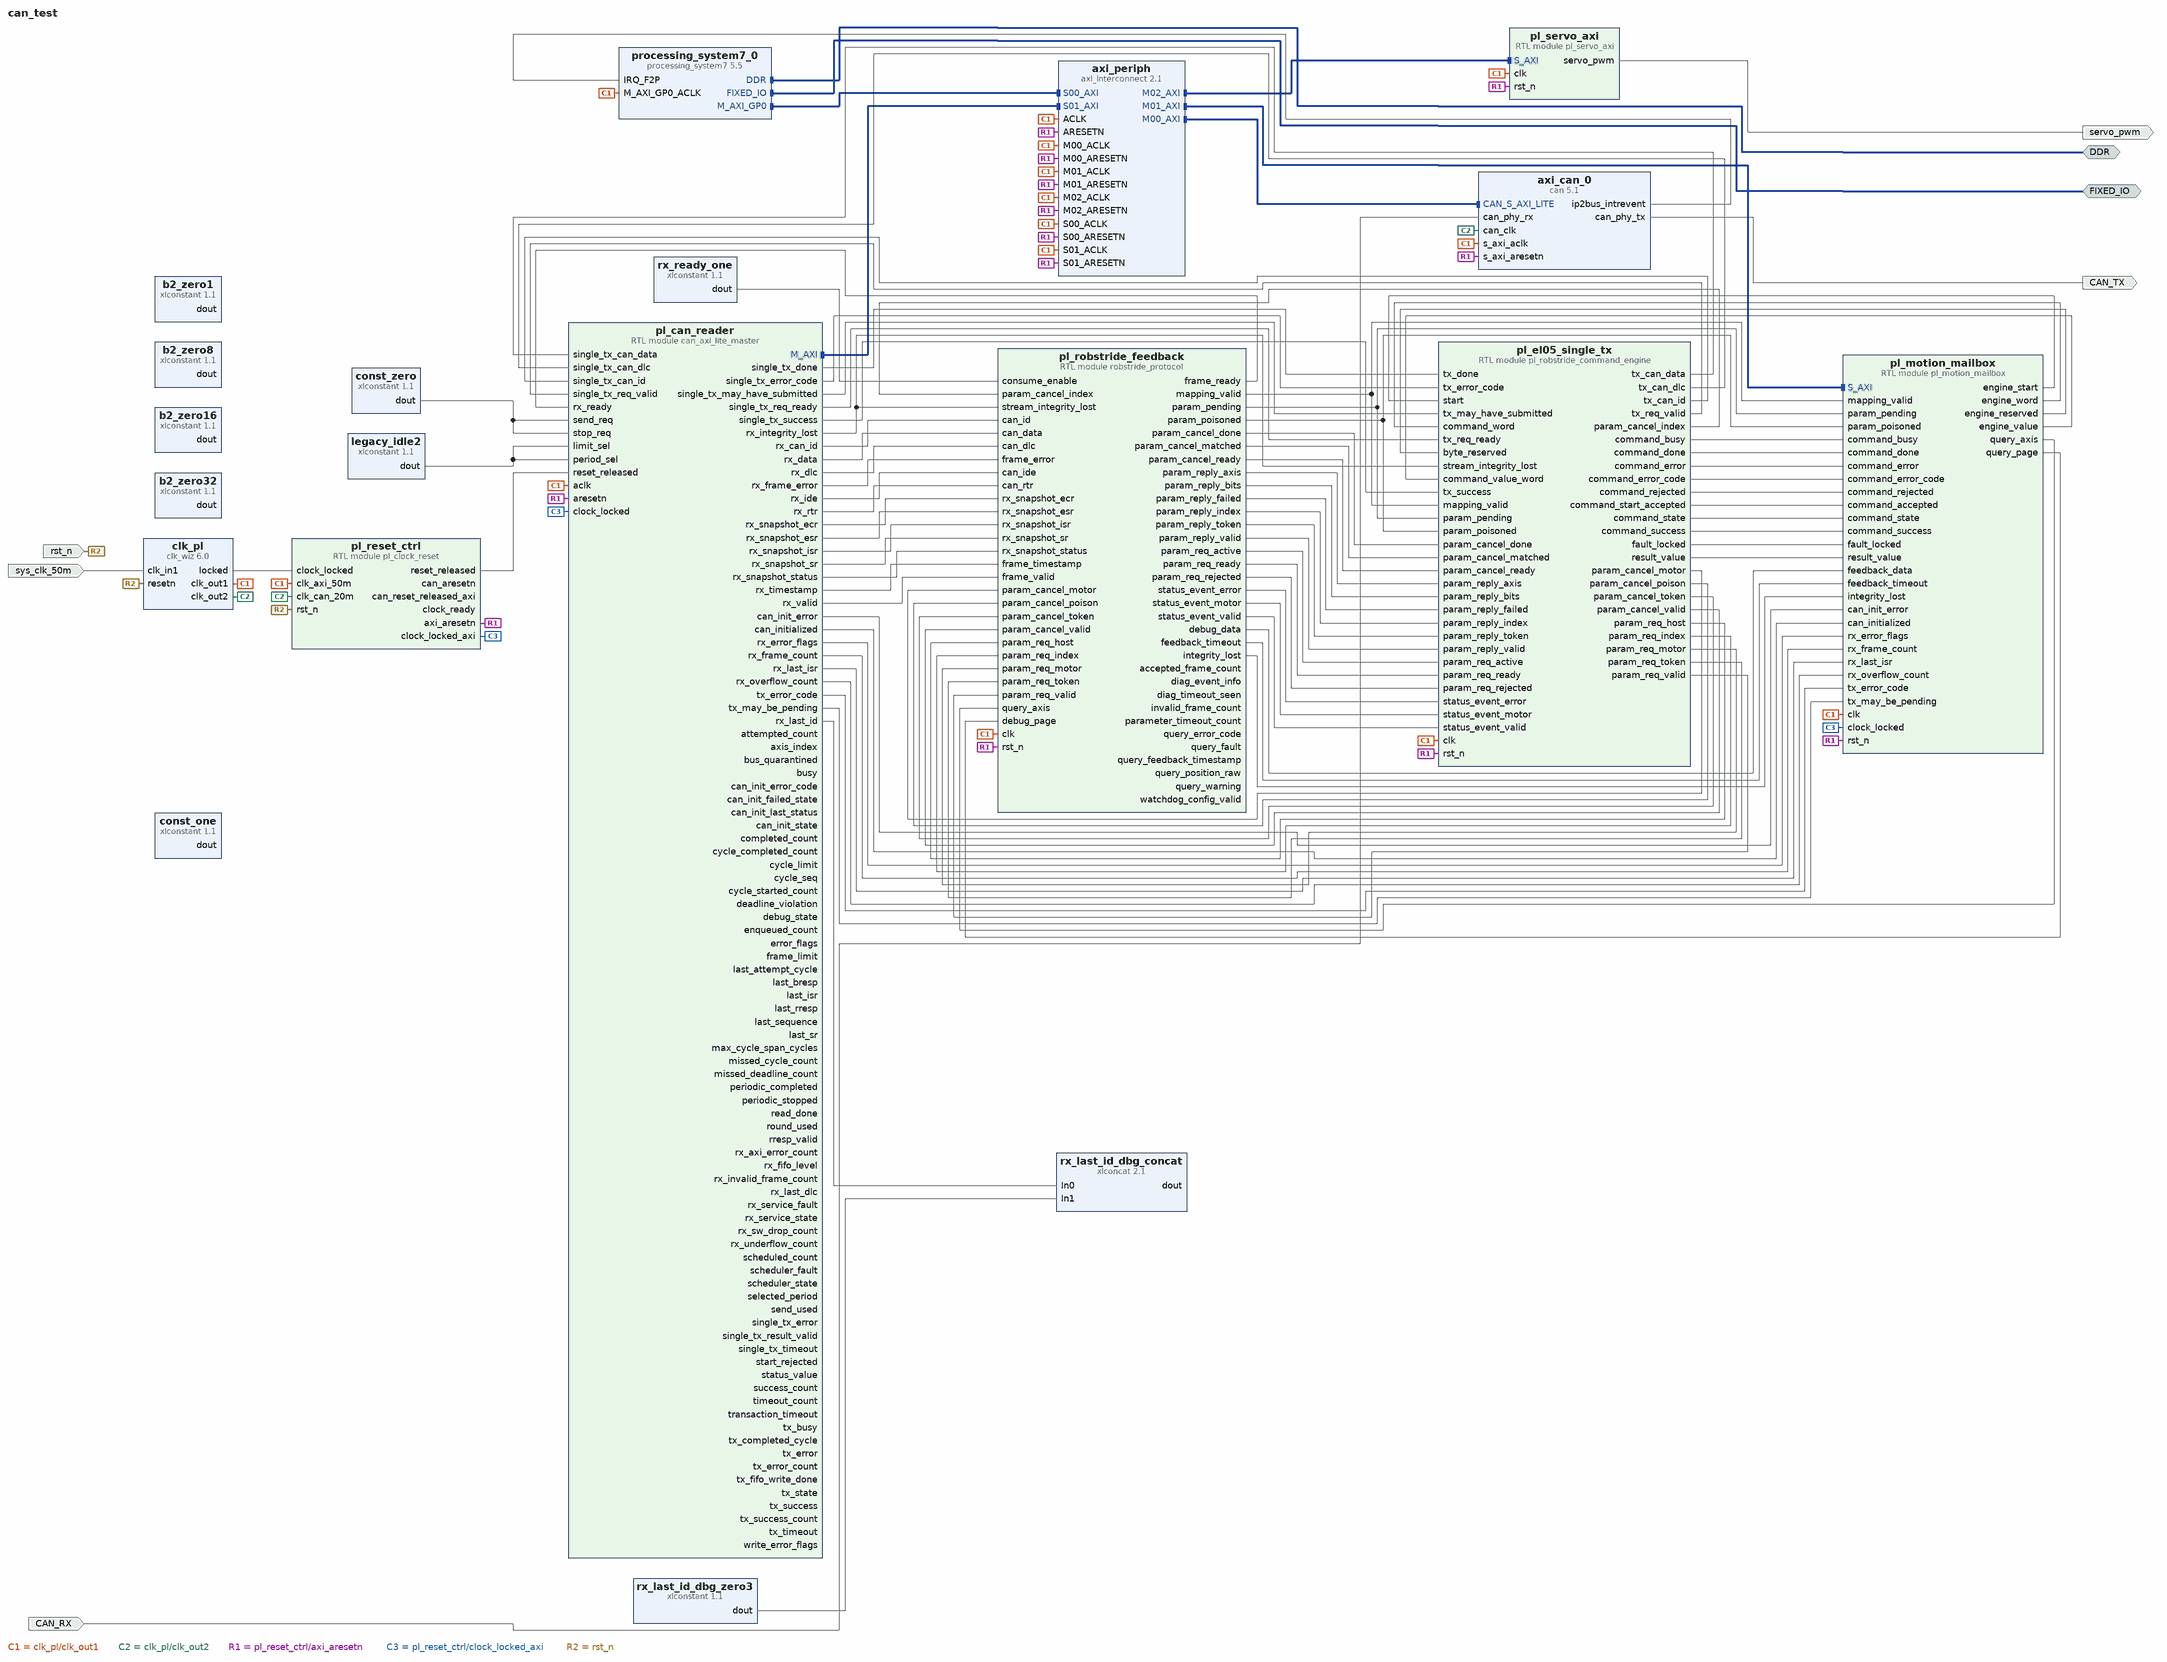
[diagram p0: block diagram of the top level]
# Vivado block design can_test, xc7z010clg400-1, Vivado 2023.1
create_bd_design can_test

create_bd_intf_port -mode Master -vlnv xilinx.com:interface:ddrx_rtl:1.0 DDR
create_bd_intf_port -mode Master -vlnv xilinx.com:display_processing_system7:fixedio_rtl:1.0 FIXED_IO
create_bd_port -dir O CAN_TX
create_bd_port -dir I CAN_RX
create_bd_port -dir I -type clk sys_clk_50m
set_property -dict {CONFIG.FREQ_HZ 50000000} [get_bd_ports sys_clk_50m]
create_bd_port -dir I -type rst rst_n
set_property -dict {CONFIG.POLARITY ACTIVE_LOW} [get_bd_ports rst_n]
create_bd_port -dir O servo_pwm

create_bd_cell -type ip -vlnv xilinx.com:ip:processing_system7:5.5 processing_system7_0
set_property -dict [list \
  CONFIG.PCW_APU_PERIPHERAL_FREQMHZ 666.666666 \
  CONFIG.PCW_ENET0_ENET0_IO {MIO 16 .. 27} \
  CONFIG.PCW_ENET0_GRP_MDIO_ENABLE 1 \
  CONFIG.PCW_ENET0_GRP_MDIO_IO {MIO 52 .. 53} \
  CONFIG.PCW_ENET0_PERIPHERAL_ENABLE 1 \
  CONFIG.PCW_ENET0_RESET_ENABLE 0 \
  CONFIG.PCW_ENET_RESET_ENABLE 1 \
  CONFIG.PCW_ENET_RESET_SELECT {Share reset pin} \
  CONFIG.PCW_EN_CLK0_PORT 0 \
  CONFIG.PCW_EN_RST0_PORT 0 \
  CONFIG.PCW_FPGA0_PERIPHERAL_FREQMHZ 50 \
  CONFIG.PCW_FPGA1_PERIPHERAL_FREQMHZ 20.000000 \
  CONFIG.PCW_GPIO_MIO_GPIO_ENABLE 1 \
  CONFIG.PCW_GPIO_MIO_GPIO_IO MIO \
  CONFIG.PCW_I2C_RESET_ENABLE 1 \
  CONFIG.PCW_IRQ_F2P_INTR 1 \
  CONFIG.PCW_PERIPHERAL_BOARD_PRESET None \
  CONFIG.PCW_PRESET_BANK1_VOLTAGE {LVCMOS 1.8V} \
  CONFIG.PCW_QSPI_GRP_SINGLE_SS_ENABLE 1 \
  CONFIG.PCW_QSPI_GRP_SINGLE_SS_IO {MIO 1 .. 6} \
  CONFIG.PCW_QSPI_PERIPHERAL_ENABLE 1 \
  CONFIG.PCW_QSPI_QSPI_IO {MIO 1 .. 6} \
  CONFIG.PCW_SD0_GRP_CD_ENABLE 1 \
  CONFIG.PCW_SD0_GRP_CD_IO {MIO 47} \
  CONFIG.PCW_SD0_GRP_WP_ENABLE 0 \
  CONFIG.PCW_SD0_PERIPHERAL_ENABLE 1 \
  CONFIG.PCW_SD0_SD0_IO {MIO 40 .. 45} \
  CONFIG.PCW_SDIO_PERIPHERAL_FREQMHZ 100 \
  CONFIG.PCW_SINGLE_QSPI_DATA_MODE x4 \
  CONFIG.PCW_UART1_PERIPHERAL_ENABLE 1 \
  CONFIG.PCW_UART1_UART1_IO {MIO 48 .. 49} \
  CONFIG.PCW_UART_PERIPHERAL_FREQMHZ 100 \
  CONFIG.PCW_UIPARAM_DDR_FREQ_MHZ 533.333333 \
  CONFIG.PCW_UIPARAM_DDR_PARTNO {MT41J128M16 HA-125} \
  CONFIG.PCW_USB0_PERIPHERAL_ENABLE 1 \
  CONFIG.PCW_USB0_RESET_ENABLE 1 \
  CONFIG.PCW_USB0_RESET_IO {MIO 46} \
  CONFIG.PCW_USB0_USB0_IO {MIO 28 .. 39} \
  CONFIG.PCW_USB_RESET_ENABLE 1 \
  CONFIG.PCW_USB_RESET_SELECT {Share reset pin} \
  CONFIG.PCW_USE_FABRIC_INTERRUPT 1 \
  CONFIG.preset None \
] [get_bd_cells processing_system7_0]
# 506 more settings of processing_system7_0 are not shown: defaults, MIO pin electricals, DDR timing, and values the tool derives
create_bd_cell -type ip -vlnv xilinx.com:ip:axi_interconnect:2.1 axi_periph
set_property -dict {CONFIG.NUM_MI 3 CONFIG.NUM_SI 2} [get_bd_cells axi_periph]
create_bd_cell -type ip -vlnv xilinx.com:ip:can:5.1 axi_can_0
set_property -dict [list \
  CONFIG.ENABLE_ECC 0 \
  CONFIG.Number_of_Acceptance_Filters 0 \
  CONFIG.Rx_Fifo_Depth 2 \
  CONFIG.Tx_Fifo_Depth 2 \
] [get_bd_cells axi_can_0]
create_bd_cell -type ip -vlnv xilinx.com:ip:xlconstant:1.1 const_zero
set_property -dict {CONFIG.CONST_VAL 0 CONFIG.CONST_WIDTH 1} [get_bd_cells const_zero]
create_bd_cell -type ip -vlnv xilinx.com:ip:xlconstant:1.1 const_one
set_property -dict {CONFIG.CONST_VAL 1 CONFIG.CONST_WIDTH 1} [get_bd_cells const_one]
create_bd_cell -type ip -vlnv xilinx.com:ip:clk_wiz:6.0 clk_pl
set_property -dict [list \
  CONFIG.CLKOUT1_DRIVES BUFG \
  CONFIG.CLKOUT1_REQUESTED_OUT_FREQ 50.000 \
  CONFIG.CLKOUT2_DRIVES BUFG \
  CONFIG.CLKOUT2_REQUESTED_OUT_FREQ 20.000 \
  CONFIG.CLKOUT2_USED true \
  CONFIG.NUM_OUT_CLKS 2 \
  CONFIG.PRIM_IN_FREQ 50.000 \
  CONFIG.RESET_TYPE ACTIVE_LOW \
  CONFIG.USE_LOCKED true \
  CONFIG.USE_RESET true \
] [get_bd_cells clk_pl]
create_bd_cell -type module -reference pl_clock_reset pl_reset_ctrl
create_bd_cell -type ip -vlnv xilinx.com:ip:xlconstant:1.1 rx_ready_one
set_property -dict {CONFIG.CONST_VAL 1 CONFIG.CONST_WIDTH 1} [get_bd_cells rx_ready_one]
create_bd_cell -type ip -vlnv xilinx.com:ip:xlconstant:1.1 b2_zero1
set_property -dict {CONFIG.CONST_VAL 0 CONFIG.CONST_WIDTH 1} [get_bd_cells b2_zero1]
create_bd_cell -type ip -vlnv xilinx.com:ip:xlconstant:1.1 b2_zero8
set_property -dict {CONFIG.CONST_VAL 0 CONFIG.CONST_WIDTH 8} [get_bd_cells b2_zero8]
create_bd_cell -type ip -vlnv xilinx.com:ip:xlconstant:1.1 b2_zero16
set_property -dict {CONFIG.CONST_VAL 0 CONFIG.CONST_WIDTH 16} [get_bd_cells b2_zero16]
create_bd_cell -type ip -vlnv xilinx.com:ip:xlconstant:1.1 b2_zero32
set_property -dict {CONFIG.CONST_VAL 0 CONFIG.CONST_WIDTH 32} [get_bd_cells b2_zero32]
create_bd_cell -type ip -vlnv xilinx.com:ip:xlconcat:2.1 rx_last_id_dbg_concat
set_property -dict {CONFIG.IN0_WIDTH 29 CONFIG.IN1_WIDTH 3 CONFIG.NUM_PORTS 2} [get_bd_cells rx_last_id_dbg_concat]
create_bd_cell -type ip -vlnv xilinx.com:ip:xlconstant:1.1 rx_last_id_dbg_zero3
set_property -dict {CONFIG.CONST_VAL 0 CONFIG.CONST_WIDTH 3} [get_bd_cells rx_last_id_dbg_zero3]
create_bd_cell -type module -reference robstride_protocol pl_robstride_feedback
set_property -dict [list \
  CONFIG.ALLOW_IDENTITY 0 \
  CONFIG.CONFIG_ENABLE 1 \
  CONFIG.FEEDBACK_TIMEOUT_CYCLES 5000000 \
  CONFIG.HOST_ID 253 \
  CONFIG.MOTOR_IDS 0x060504030201 \
  CONFIG.PARAM_TIMEOUT_CYCLES 5000000 \
] [get_bd_cells pl_robstride_feedback]
create_bd_cell -type module -reference can_axi_lite_master pl_can_reader
set_property -dict [list \
  CONFIG.ENABLE_PERIODIC 1 \
  CONFIG.ENABLE_PL_INIT 1 \
  CONFIG.ENABLE_RX 1 \
  CONFIG.ENABLE_SINGLE_TX 1 \
  CONFIG.ENABLE_SIX_AXIS 1 \
  CONFIG.INIT_POLL_CYCLES 5000 \
  CONFIG.INIT_TIMEOUT_CYCLES 50000000 \
  CONFIG.PERIOD_100HZ_CYCLES 500000 \
  CONFIG.PERIOD_10HZ_CYCLES 5000000 \
  CONFIG.PERIOD_200HZ_CYCLES 250000 \
  CONFIG.POLL_INTERVAL_CYCLES 5000000 \
  CONFIG.RX_FIFO_DEPTH 16 \
  CONFIG.RX_POLL_CYCLES 2500 \
  CONFIG.SEND_TIMEOUT_CYCLES 1000000 \
  CONFIG.TIMEOUT_CYCLES 50000 \
  CONFIG.TXOK_POLL_CYCLES 5000 \
  CONFIG.TXOK_TIMEOUT_CYCLES 500000 \
] [get_bd_cells pl_can_reader]
create_bd_cell -type ip -vlnv xilinx.com:ip:xlconstant:1.1 legacy_idle2
set_property -dict {CONFIG.CONST_VAL 0 CONFIG.CONST_WIDTH 2} [get_bd_cells legacy_idle2]
create_bd_cell -type module -reference pl_servo_axi pl_servo_axi
create_bd_cell -type module -reference pl_robstride_command_engine pl_el05_single_tx
set_property -dict [list \
  CONFIG.ENABLE_HOLD_PP 1 \
  CONFIG.ENABLE_MULTI_PP 1 \
  CONFIG.ENABLE_PATH_PP 1 \
  CONFIG.ENABLE_PP_TEST 1 \
  CONFIG.PATH_LEASE_CYCLES {"00000001011111010111100001000000"} \
  CONFIG.PATH_MAX_STEP_Q16 6554 \
  CONFIG.PATH_POSITION_AGE_CYCLES {"00000001011111010111100001000000"} \
  CONFIG.PATH_WINDOW_CYCLES {"10110010110100000101111000000000"} \
  CONFIG.PP_MAX_ACCEL_BITS 0x404CCCCD \
  CONFIG.PP_MAX_DELTA_Q16 824442 \
  CONFIG.PP_MAX_SPEED_BITS 0x404CCCCD \
  CONFIG.PP_POSITION_AGE_CYCLES 1500000000 \
  CONFIG.PP_WINDOW_CYCLES 500000000 \
] [get_bd_cells pl_el05_single_tx]
create_bd_cell -type module -reference pl_motion_mailbox pl_motion_mailbox
set_property -dict {CONFIG.ABI_VERSION 0x00020009} [get_bd_cells pl_motion_mailbox]

# ---- connections ----

connect_bd_intf_net [get_bd_intf_pins axi_periph/M00_AXI] [get_bd_intf_pins axi_can_0/CAN_S_AXI_LITE]
connect_bd_intf_net [get_bd_intf_pins axi_periph/M01_AXI] [get_bd_intf_pins pl_motion_mailbox/S_AXI]
connect_bd_intf_net [get_bd_intf_pins axi_periph/M02_AXI] [get_bd_intf_pins pl_servo_axi/S_AXI]
connect_bd_intf_net [get_bd_intf_pins pl_can_reader/M_AXI] [get_bd_intf_pins axi_periph/S01_AXI]
connect_bd_intf_net [get_bd_intf_ports DDR] [get_bd_intf_pins processing_system7_0/DDR]
connect_bd_intf_net [get_bd_intf_ports FIXED_IO] [get_bd_intf_pins processing_system7_0/FIXED_IO]
connect_bd_intf_net [get_bd_intf_pins processing_system7_0/M_AXI_GP0] [get_bd_intf_pins axi_periph/S00_AXI]
connect_bd_net [get_bd_ports CAN_RX] [get_bd_pins axi_can_0/can_phy_rx]
connect_bd_net [get_bd_pins axi_can_0/can_phy_tx] [get_bd_ports CAN_TX]
connect_bd_net [get_bd_pins axi_can_0/ip2bus_intrevent] [get_bd_pins processing_system7_0/IRQ_F2P]
# net b2_zero16_dout has one end: b2_zero16/dout
# net b2_zero1_dout has one end: b2_zero1/dout
# net b2_zero32_dout has one end: b2_zero32/dout
# net b2_zero8_dout has one end: b2_zero8/dout
connect_bd_net [get_bd_pins clk_pl/clk_out1] \
  [get_bd_pins processing_system7_0/M_AXI_GP0_ACLK] [get_bd_pins axi_periph/ACLK] [get_bd_pins axi_periph/S00_ACLK] \
  [get_bd_pins axi_periph/M00_ACLK] [get_bd_pins axi_can_0/s_axi_aclk] [get_bd_pins axi_periph/S01_ACLK] \
  [get_bd_pins pl_reset_ctrl/clk_axi_50m] [get_bd_pins pl_robstride_feedback/clk] [get_bd_pins pl_can_reader/aclk] \
  [get_bd_pins axi_periph/M01_ACLK] [get_bd_pins axi_periph/M02_ACLK] [get_bd_pins pl_servo_axi/clk] \
  [get_bd_pins pl_el05_single_tx/clk] [get_bd_pins pl_motion_mailbox/clk]
connect_bd_net [get_bd_pins clk_pl/clk_out2] [get_bd_pins axi_can_0/can_clk] [get_bd_pins pl_reset_ctrl/clk_can_20m]
connect_bd_net [get_bd_pins clk_pl/locked] [get_bd_pins pl_reset_ctrl/clock_locked]
# net const_one_dout has one end: const_one/dout
connect_bd_net [get_bd_pins const_zero/dout] [get_bd_pins pl_can_reader/send_req] [get_bd_pins pl_can_reader/stop_req]
connect_bd_net [get_bd_pins legacy_idle2/dout] [get_bd_pins pl_can_reader/period_sel] [get_bd_pins pl_can_reader/limit_sel]
# net pl_can_reader_attempted_count has one end: pl_can_reader/attempted_count
# net pl_can_reader_axis_index has one end: pl_can_reader/axis_index
# net pl_can_reader_bus_quarantined has one end: pl_can_reader/bus_quarantined
# net pl_can_reader_busy has one end: pl_can_reader/busy
connect_bd_net [get_bd_pins pl_can_reader/can_init_error] [get_bd_pins pl_motion_mailbox/can_init_error]
# net pl_can_reader_can_init_error_code has one end: pl_can_reader/can_init_error_code
# net pl_can_reader_can_init_failed_state has one end: pl_can_reader/can_init_failed_state
# net pl_can_reader_can_init_last_status has one end: pl_can_reader/can_init_last_status
# net pl_can_reader_can_init_state has one end: pl_can_reader/can_init_state
connect_bd_net [get_bd_pins pl_can_reader/can_initialized] [get_bd_pins pl_motion_mailbox/can_initialized]
# net pl_can_reader_completed_count has one end: pl_can_reader/completed_count
# net pl_can_reader_cycle_completed_count has one end: pl_can_reader/cycle_completed_count
# net pl_can_reader_cycle_limit has one end: pl_can_reader/cycle_limit
# net pl_can_reader_cycle_seq has one end: pl_can_reader/cycle_seq
# net pl_can_reader_cycle_started_count has one end: pl_can_reader/cycle_started_count
# net pl_can_reader_deadline_violation has one end: pl_can_reader/deadline_violation
# net pl_can_reader_debug_state has one end: pl_can_reader/debug_state
# net pl_can_reader_enqueued_count has one end: pl_can_reader/enqueued_count
# net pl_can_reader_error_flags has one end: pl_can_reader/error_flags
# net pl_can_reader_frame_limit has one end: pl_can_reader/frame_limit
# net pl_can_reader_last_attempt_cycle has one end: pl_can_reader/last_attempt_cycle
# net pl_can_reader_last_bresp has one end: pl_can_reader/last_bresp
# net pl_can_reader_last_isr has one end: pl_can_reader/last_isr
# net pl_can_reader_last_rresp has one end: pl_can_reader/last_rresp
# net pl_can_reader_last_sequence has one end: pl_can_reader/last_sequence
# net pl_can_reader_last_sr has one end: pl_can_reader/last_sr
# net pl_can_reader_max_cycle_span_cycles has one end: pl_can_reader/max_cycle_span_cycles
# net pl_can_reader_missed_cycle_count has one end: pl_can_reader/missed_cycle_count
# net pl_can_reader_missed_deadline_count has one end: pl_can_reader/missed_deadline_count
# net pl_can_reader_periodic_completed has one end: pl_can_reader/periodic_completed
# net pl_can_reader_periodic_stopped has one end: pl_can_reader/periodic_stopped
# net pl_can_reader_read_done has one end: pl_can_reader/read_done
# net pl_can_reader_round_used has one end: pl_can_reader/round_used
# net pl_can_reader_rresp_valid has one end: pl_can_reader/rresp_valid
# net pl_can_reader_rx_axi_error_count has one end: pl_can_reader/rx_axi_error_count
connect_bd_net [get_bd_pins pl_can_reader/rx_can_id] [get_bd_pins pl_robstride_feedback/can_id]
connect_bd_net [get_bd_pins pl_can_reader/rx_data] [get_bd_pins pl_robstride_feedback/can_data]
connect_bd_net [get_bd_pins pl_can_reader/rx_dlc] [get_bd_pins pl_robstride_feedback/can_dlc]
connect_bd_net [get_bd_pins pl_can_reader/rx_error_flags] [get_bd_pins pl_motion_mailbox/rx_error_flags]
# net pl_can_reader_rx_fifo_level has one end: pl_can_reader/rx_fifo_level
connect_bd_net [get_bd_pins pl_can_reader/rx_frame_count] [get_bd_pins pl_motion_mailbox/rx_frame_count]
connect_bd_net [get_bd_pins pl_can_reader/rx_frame_error] [get_bd_pins pl_robstride_feedback/frame_error]
connect_bd_net [get_bd_pins pl_can_reader/rx_ide] [get_bd_pins pl_robstride_feedback/can_ide]
connect_bd_net [get_bd_pins pl_can_reader/rx_integrity_lost] \
  [get_bd_pins pl_robstride_feedback/stream_integrity_lost] [get_bd_pins pl_el05_single_tx/stream_integrity_lost]
# net pl_can_reader_rx_invalid_frame_count has one end: pl_can_reader/rx_invalid_frame_count
# net pl_can_reader_rx_last_dlc has one end: pl_can_reader/rx_last_dlc
connect_bd_net [get_bd_pins pl_can_reader/rx_last_id] [get_bd_pins rx_last_id_dbg_concat/In0]
connect_bd_net [get_bd_pins pl_can_reader/rx_last_isr] [get_bd_pins pl_motion_mailbox/rx_last_isr]
connect_bd_net [get_bd_pins pl_can_reader/rx_overflow_count] [get_bd_pins pl_motion_mailbox/rx_overflow_count]
connect_bd_net [get_bd_pins pl_can_reader/rx_rtr] [get_bd_pins pl_robstride_feedback/can_rtr]
# net pl_can_reader_rx_service_fault has one end: pl_can_reader/rx_service_fault
# net pl_can_reader_rx_service_state has one end: pl_can_reader/rx_service_state
connect_bd_net [get_bd_pins pl_can_reader/rx_snapshot_ecr] [get_bd_pins pl_robstride_feedback/rx_snapshot_ecr]
connect_bd_net [get_bd_pins pl_can_reader/rx_snapshot_esr] [get_bd_pins pl_robstride_feedback/rx_snapshot_esr]
connect_bd_net [get_bd_pins pl_can_reader/rx_snapshot_isr] [get_bd_pins pl_robstride_feedback/rx_snapshot_isr]
connect_bd_net [get_bd_pins pl_can_reader/rx_snapshot_sr] [get_bd_pins pl_robstride_feedback/rx_snapshot_sr]
connect_bd_net [get_bd_pins pl_can_reader/rx_snapshot_status] [get_bd_pins pl_robstride_feedback/rx_snapshot_status]
# net pl_can_reader_rx_sw_drop_count has one end: pl_can_reader/rx_sw_drop_count
connect_bd_net [get_bd_pins pl_can_reader/rx_timestamp] [get_bd_pins pl_robstride_feedback/frame_timestamp]
# net pl_can_reader_rx_underflow_count has one end: pl_can_reader/rx_underflow_count
connect_bd_net [get_bd_pins pl_can_reader/rx_valid] [get_bd_pins pl_robstride_feedback/frame_valid]
# net pl_can_reader_scheduled_count has one end: pl_can_reader/scheduled_count
# net pl_can_reader_scheduler_fault has one end: pl_can_reader/scheduler_fault
# net pl_can_reader_scheduler_state has one end: pl_can_reader/scheduler_state
# net pl_can_reader_selected_period has one end: pl_can_reader/selected_period
# net pl_can_reader_send_used has one end: pl_can_reader/send_used
connect_bd_net [get_bd_pins pl_can_reader/single_tx_done] [get_bd_pins pl_el05_single_tx/tx_done]
# net pl_can_reader_single_tx_error has one end: pl_can_reader/single_tx_error
connect_bd_net [get_bd_pins pl_can_reader/single_tx_error_code] [get_bd_pins pl_el05_single_tx/tx_error_code]
connect_bd_net [get_bd_pins pl_can_reader/single_tx_may_have_submitted] [get_bd_pins pl_el05_single_tx/tx_may_have_submitted]
connect_bd_net [get_bd_pins pl_can_reader/single_tx_req_ready] [get_bd_pins pl_el05_single_tx/tx_req_ready]
# net pl_can_reader_single_tx_result_valid has one end: pl_can_reader/single_tx_result_valid
connect_bd_net [get_bd_pins pl_can_reader/single_tx_success] [get_bd_pins pl_el05_single_tx/tx_success]
# net pl_can_reader_single_tx_timeout has one end: pl_can_reader/single_tx_timeout
# net pl_can_reader_start_rejected has one end: pl_can_reader/start_rejected
# net pl_can_reader_status_value has one end: pl_can_reader/status_value
# net pl_can_reader_success_count has one end: pl_can_reader/success_count
# net pl_can_reader_timeout_count has one end: pl_can_reader/timeout_count
# net pl_can_reader_transaction_timeout has one end: pl_can_reader/transaction_timeout
# net pl_can_reader_tx_busy has one end: pl_can_reader/tx_busy
# net pl_can_reader_tx_completed_cycle has one end: pl_can_reader/tx_completed_cycle
# net pl_can_reader_tx_error has one end: pl_can_reader/tx_error
connect_bd_net [get_bd_pins pl_can_reader/tx_error_code] [get_bd_pins pl_motion_mailbox/tx_error_code]
# net pl_can_reader_tx_error_count has one end: pl_can_reader/tx_error_count
# net pl_can_reader_tx_fifo_write_done has one end: pl_can_reader/tx_fifo_write_done
connect_bd_net [get_bd_pins pl_can_reader/tx_may_be_pending] [get_bd_pins pl_motion_mailbox/tx_may_be_pending]
# net pl_can_reader_tx_state has one end: pl_can_reader/tx_state
# net pl_can_reader_tx_success has one end: pl_can_reader/tx_success
# net pl_can_reader_tx_success_count has one end: pl_can_reader/tx_success_count
# net pl_can_reader_tx_timeout has one end: pl_can_reader/tx_timeout
# net pl_can_reader_write_error_flags has one end: pl_can_reader/write_error_flags
connect_bd_net [get_bd_pins pl_el05_single_tx/command_busy] [get_bd_pins pl_motion_mailbox/command_busy]
connect_bd_net [get_bd_pins pl_el05_single_tx/command_done] [get_bd_pins pl_motion_mailbox/command_done]
connect_bd_net [get_bd_pins pl_el05_single_tx/command_error] [get_bd_pins pl_motion_mailbox/command_error]
connect_bd_net [get_bd_pins pl_el05_single_tx/command_error_code] [get_bd_pins pl_motion_mailbox/command_error_code]
connect_bd_net [get_bd_pins pl_el05_single_tx/command_rejected] [get_bd_pins pl_motion_mailbox/command_rejected]
connect_bd_net [get_bd_pins pl_el05_single_tx/command_start_accepted] [get_bd_pins pl_motion_mailbox/command_accepted]
connect_bd_net [get_bd_pins pl_el05_single_tx/command_state] [get_bd_pins pl_motion_mailbox/command_state]
connect_bd_net [get_bd_pins pl_el05_single_tx/command_success] [get_bd_pins pl_motion_mailbox/command_success]
connect_bd_net [get_bd_pins pl_el05_single_tx/fault_locked] [get_bd_pins pl_motion_mailbox/fault_locked]
connect_bd_net [get_bd_pins pl_el05_single_tx/param_cancel_index] [get_bd_pins pl_robstride_feedback/param_cancel_index]
connect_bd_net [get_bd_pins pl_el05_single_tx/param_cancel_motor] [get_bd_pins pl_robstride_feedback/param_cancel_motor]
connect_bd_net [get_bd_pins pl_el05_single_tx/param_cancel_poison] [get_bd_pins pl_robstride_feedback/param_cancel_poison]
connect_bd_net [get_bd_pins pl_el05_single_tx/param_cancel_token] [get_bd_pins pl_robstride_feedback/param_cancel_token]
connect_bd_net [get_bd_pins pl_el05_single_tx/param_cancel_valid] [get_bd_pins pl_robstride_feedback/param_cancel_valid]
connect_bd_net [get_bd_pins pl_el05_single_tx/param_req_host] [get_bd_pins pl_robstride_feedback/param_req_host]
connect_bd_net [get_bd_pins pl_el05_single_tx/param_req_index] [get_bd_pins pl_robstride_feedback/param_req_index]
connect_bd_net [get_bd_pins pl_el05_single_tx/param_req_motor] [get_bd_pins pl_robstride_feedback/param_req_motor]
connect_bd_net [get_bd_pins pl_el05_single_tx/param_req_token] [get_bd_pins pl_robstride_feedback/param_req_token]
connect_bd_net [get_bd_pins pl_el05_single_tx/param_req_valid] [get_bd_pins pl_robstride_feedback/param_req_valid]
connect_bd_net [get_bd_pins pl_el05_single_tx/result_value] [get_bd_pins pl_motion_mailbox/result_value]
connect_bd_net [get_bd_pins pl_el05_single_tx/tx_can_data] [get_bd_pins pl_can_reader/single_tx_can_data]
connect_bd_net [get_bd_pins pl_el05_single_tx/tx_can_dlc] [get_bd_pins pl_can_reader/single_tx_can_dlc]
connect_bd_net [get_bd_pins pl_el05_single_tx/tx_can_id] [get_bd_pins pl_can_reader/single_tx_can_id]
connect_bd_net [get_bd_pins pl_el05_single_tx/tx_req_valid] [get_bd_pins pl_can_reader/single_tx_req_valid]
connect_bd_net [get_bd_pins pl_reset_ctrl/axi_aresetn] \
  [get_bd_pins axi_periph/ARESETN] [get_bd_pins axi_periph/S00_ARESETN] [get_bd_pins axi_periph/M00_ARESETN] \
  [get_bd_pins axi_can_0/s_axi_aresetn] [get_bd_pins axi_periph/S01_ARESETN] [get_bd_pins pl_robstride_feedback/rst_n] \
  [get_bd_pins pl_can_reader/aresetn] [get_bd_pins axi_periph/M01_ARESETN] [get_bd_pins axi_periph/M02_ARESETN] \
  [get_bd_pins pl_servo_axi/rst_n] [get_bd_pins pl_el05_single_tx/rst_n] [get_bd_pins pl_motion_mailbox/rst_n]
# net pl_reset_ctrl_can_aresetn has one end: pl_reset_ctrl/can_aresetn
# net pl_reset_ctrl_can_reset_released_axi has one end: pl_reset_ctrl/can_reset_released_axi
connect_bd_net [get_bd_pins pl_reset_ctrl/clock_locked_axi] [get_bd_pins pl_can_reader/clock_locked] [get_bd_pins pl_motion_mailbox/clock_locked]
# net pl_reset_ctrl_clock_ready has one end: pl_reset_ctrl/clock_ready
connect_bd_net [get_bd_pins pl_reset_ctrl/reset_released] [get_bd_pins pl_can_reader/reset_released]
# net pl_robstride_feedback_accepted_frame_count has one end: pl_robstride_feedback/accepted_frame_count
connect_bd_net [get_bd_pins pl_robstride_feedback/debug_data] [get_bd_pins pl_motion_mailbox/feedback_data]
# net pl_robstride_feedback_diag_event_info has one end: pl_robstride_feedback/diag_event_info
# net pl_robstride_feedback_diag_timeout_seen has one end: pl_robstride_feedback/diag_timeout_seen
connect_bd_net [get_bd_pins pl_robstride_feedback/feedback_timeout] [get_bd_pins pl_motion_mailbox/feedback_timeout]
connect_bd_net [get_bd_pins pl_robstride_feedback/frame_ready] [get_bd_pins pl_can_reader/rx_ready]
connect_bd_net [get_bd_pins pl_robstride_feedback/integrity_lost] [get_bd_pins pl_motion_mailbox/integrity_lost]
# net pl_robstride_feedback_invalid_frame_count has one end: pl_robstride_feedback/invalid_frame_count
connect_bd_net [get_bd_pins pl_robstride_feedback/mapping_valid] \
  [get_bd_pins pl_el05_single_tx/mapping_valid] [get_bd_pins pl_motion_mailbox/mapping_valid]
connect_bd_net [get_bd_pins pl_robstride_feedback/param_cancel_done] [get_bd_pins pl_el05_single_tx/param_cancel_done]
connect_bd_net [get_bd_pins pl_robstride_feedback/param_cancel_matched] [get_bd_pins pl_el05_single_tx/param_cancel_matched]
connect_bd_net [get_bd_pins pl_robstride_feedback/param_cancel_ready] [get_bd_pins pl_el05_single_tx/param_cancel_ready]
connect_bd_net [get_bd_pins pl_robstride_feedback/param_pending] \
  [get_bd_pins pl_el05_single_tx/param_pending] [get_bd_pins pl_motion_mailbox/param_pending]
connect_bd_net [get_bd_pins pl_robstride_feedback/param_poisoned] \
  [get_bd_pins pl_el05_single_tx/param_poisoned] [get_bd_pins pl_motion_mailbox/param_poisoned]
connect_bd_net [get_bd_pins pl_robstride_feedback/param_reply_axis] [get_bd_pins pl_el05_single_tx/param_reply_axis]
connect_bd_net [get_bd_pins pl_robstride_feedback/param_reply_bits] [get_bd_pins pl_el05_single_tx/param_reply_bits]
connect_bd_net [get_bd_pins pl_robstride_feedback/param_reply_failed] [get_bd_pins pl_el05_single_tx/param_reply_failed]
connect_bd_net [get_bd_pins pl_robstride_feedback/param_reply_index] [get_bd_pins pl_el05_single_tx/param_reply_index]
connect_bd_net [get_bd_pins pl_robstride_feedback/param_reply_token] [get_bd_pins pl_el05_single_tx/param_reply_token]
connect_bd_net [get_bd_pins pl_robstride_feedback/param_reply_valid] [get_bd_pins pl_el05_single_tx/param_reply_valid]
connect_bd_net [get_bd_pins pl_robstride_feedback/param_req_active] [get_bd_pins pl_el05_single_tx/param_req_active]
connect_bd_net [get_bd_pins pl_robstride_feedback/param_req_ready] [get_bd_pins pl_el05_single_tx/param_req_ready]
connect_bd_net [get_bd_pins pl_robstride_feedback/param_req_rejected] [get_bd_pins pl_el05_single_tx/param_req_rejected]
# net pl_robstride_feedback_parameter_timeout_count has one end: pl_robstride_feedback/parameter_timeout_count
# net pl_robstride_feedback_query_error_code has one end: pl_robstride_feedback/query_error_code
# net pl_robstride_feedback_query_fault has one end: pl_robstride_feedback/query_fault
# net pl_robstride_feedback_query_feedback_timestamp has one end: pl_robstride_feedback/query_feedback_timestamp
# net pl_robstride_feedback_query_position_raw has one end: pl_robstride_feedback/query_position_raw
# net pl_robstride_feedback_query_warning has one end: pl_robstride_feedback/query_warning
connect_bd_net [get_bd_pins pl_robstride_feedback/status_event_error] [get_bd_pins pl_el05_single_tx/status_event_error]
connect_bd_net [get_bd_pins pl_robstride_feedback/status_event_motor] [get_bd_pins pl_el05_single_tx/status_event_motor]
connect_bd_net [get_bd_pins pl_robstride_feedback/status_event_valid] [get_bd_pins pl_el05_single_tx/status_event_valid]
# net pl_robstride_feedback_watchdog_config_valid has one end: pl_robstride_feedback/watchdog_config_valid
connect_bd_net [get_bd_pins pl_servo_axi/servo_pwm] [get_bd_ports servo_pwm]
connect_bd_net [get_bd_ports rst_n] [get_bd_pins clk_pl/resetn] [get_bd_pins pl_reset_ctrl/rst_n]
# net rx_last_id_dbg_concat_dout has one end: rx_last_id_dbg_concat/dout
connect_bd_net [get_bd_pins rx_last_id_dbg_zero3/dout] [get_bd_pins rx_last_id_dbg_concat/In1]
connect_bd_net [get_bd_pins rx_ready_one/dout] [get_bd_pins pl_robstride_feedback/consume_enable]
connect_bd_net [get_bd_ports sys_clk_50m] [get_bd_pins clk_pl/clk_in1]
connect_bd_net -net vio_el05_single_tx_probe_out0 [get_bd_pins pl_motion_mailbox/engine_start] [get_bd_pins pl_el05_single_tx/start]
connect_bd_net -net vio_el05_single_tx_probe_out1 [get_bd_pins pl_motion_mailbox/engine_word] [get_bd_pins pl_el05_single_tx/command_word]
connect_bd_net -net vio_el05_single_tx_probe_out2 [get_bd_pins pl_motion_mailbox/engine_reserved] [get_bd_pins pl_el05_single_tx/byte_reserved]
connect_bd_net -net vio_el05_single_tx_probe_out3 [get_bd_pins pl_motion_mailbox/engine_value] [get_bd_pins pl_el05_single_tx/command_value_word]
connect_bd_net -net vio_feedback_debug_probe_out0 [get_bd_pins pl_motion_mailbox/query_axis] [get_bd_pins pl_robstride_feedback/query_axis]
connect_bd_net -net vio_feedback_debug_probe_out1 [get_bd_pins pl_motion_mailbox/query_page] [get_bd_pins pl_robstride_feedback/debug_page]

# ---- address map ----
assign_bd_address -offset 0x40000000 -range 4K -target_address_space [get_bd_addr_spaces pl_can_reader/M_AXI] [get_bd_addr_segs pl_motion_mailbox/S_AXI/reg0]
assign_bd_address -offset 0x43C00000 -range 64K -target_address_space [get_bd_addr_spaces pl_can_reader/M_AXI] [get_bd_addr_segs axi_can_0/CAN_S_AXI_LITE/Reg]
exclude_bd_addr_seg -offset 0x40001000 -range 4K -target_address_space [get_bd_addr_spaces pl_can_reader/M_AXI] [get_bd_addr_segs pl_servo_axi/S_AXI/reg0]
assign_bd_address -offset 0x40000000 -range 4K -target_address_space [get_bd_addr_spaces processing_system7_0/Data] [get_bd_addr_segs pl_motion_mailbox/S_AXI/reg0]
assign_bd_address -offset 0x40001000 -range 4K -target_address_space [get_bd_addr_spaces processing_system7_0/Data] [get_bd_addr_segs pl_servo_axi/S_AXI/reg0]
assign_bd_address -offset 0x43C00000 -range 64K -target_address_space [get_bd_addr_spaces processing_system7_0/Data] [get_bd_addr_segs axi_can_0/CAN_S_AXI_LITE/Reg]

validate_bd_design
save_bd_design
